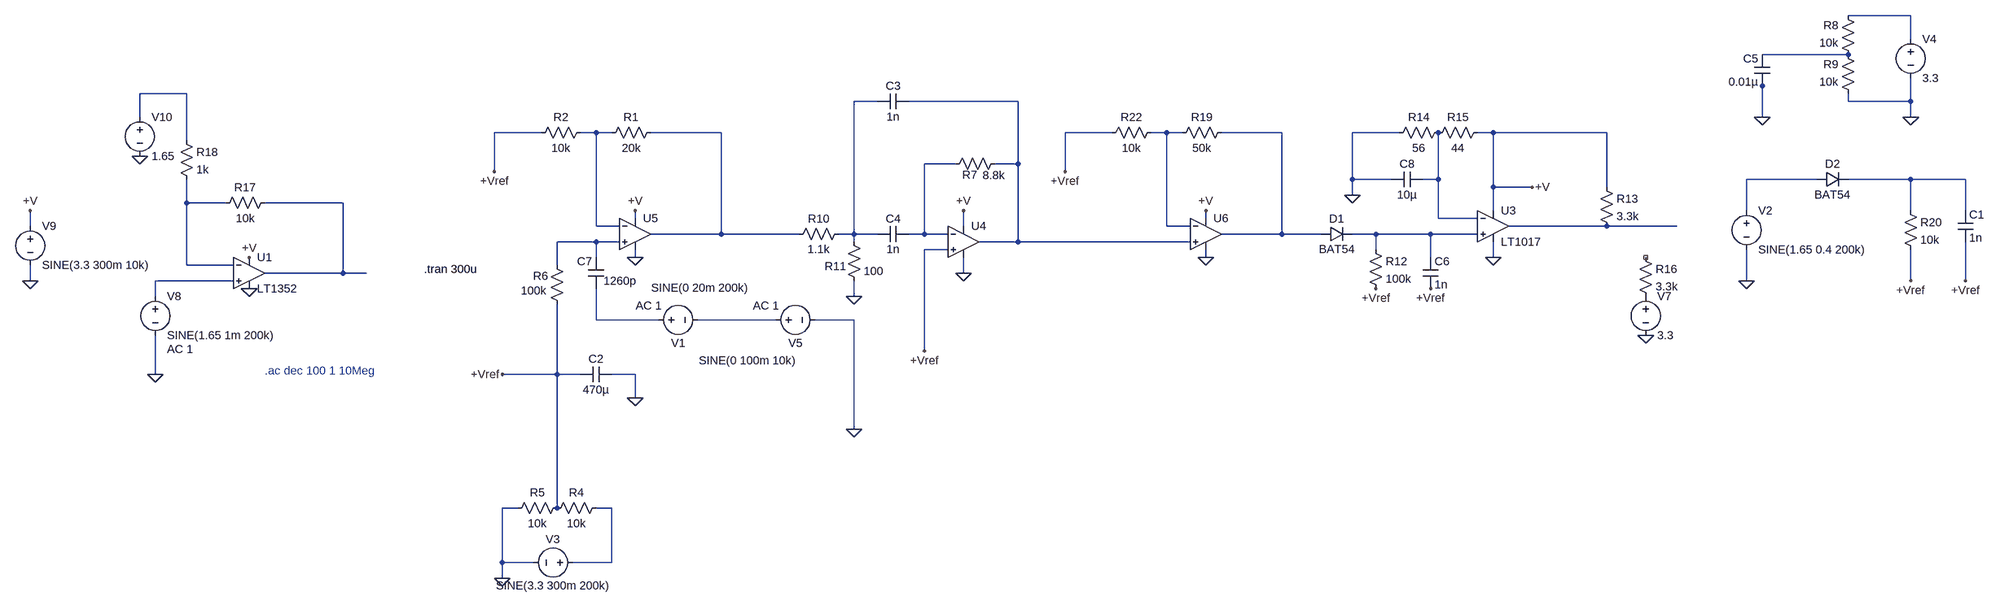
[diagram p0: schematic RX_module.asc]
RX_module.asc, the LTspice schematic file:
Version 4.1
SHEET 1 4340 1120
WIRE 3104 -96 2976 -96
WIRE 3104 -48 3104 -96
WIRE 2976 -16 2800 -16
WIRE 2800 48 2800 32
WIRE -528 64 -624 64
WIRE 896 80 848 80
WIRE 1184 80 960 80
WIRE 2976 80 2976 64
WIRE 3104 80 3104 32
WIRE 3104 80 2976 80
WIRE -624 112 -624 64
WIRE 2800 112 2800 48
WIRE 3104 112 3104 80
WIRE 208 144 112 144
WIRE 320 144 288 144
WIRE 352 144 320 144
WIRE 576 144 432 144
WIRE 1376 144 1280 144
WIRE 1488 144 1456 144
WIRE 1520 144 1488 144
WIRE 1744 144 1600 144
WIRE 1984 144 1888 144
WIRE 2176 144 2144 144
WIRE 2480 144 2176 144
WIRE -528 160 -528 64
WIRE 1056 208 992 208
WIRE 1184 208 1184 80
WIRE 1184 208 1136 208
WIRE 112 224 112 144
WIRE 1280 224 1280 144
WIRE 1888 240 1888 144
WIRE 1968 240 1888 240
WIRE 2064 240 2064 144
WIRE 2064 240 2032 240
WIRE 2912 240 2768 240
WIRE 3104 240 2976 240
WIRE 3216 240 3104 240
WIRE 2176 256 2176 144
WIRE 2256 256 2176 256
WIRE 2480 256 2480 144
WIRE 1888 272 1888 240
WIRE -528 288 -528 240
WIRE -448 288 -528 288
WIRE -208 288 -368 288
WIRE 2176 304 2176 256
WIRE 2768 304 2768 240
WIRE 3104 304 3104 240
WIRE 3216 304 3216 240
WIRE 400 320 400 304
WIRE 1568 320 1568 304
WIRE 2064 320 2064 240
WIRE 2144 320 2064 320
WIRE -848 336 -848 304
WIRE 320 336 320 144
WIRE 368 336 320 336
WIRE 1072 336 1072 304
WIRE 1488 336 1488 144
WIRE 1536 336 1488 336
WIRE 2480 336 2208 336
WIRE 2624 336 2480 336
WIRE 576 352 576 144
WIRE 576 352 432 352
WIRE 736 352 576 352
WIRE 848 352 848 80
WIRE 848 352 816 352
WIRE 896 352 848 352
WIRE 992 352 992 208
WIRE 992 352 960 352
WIRE 1040 352 992 352
WIRE 1744 352 1744 144
WIRE 1744 352 1600 352
WIRE 1824 352 1744 352
WIRE 1936 352 1888 352
WIRE 2048 352 1936 352
WIRE 2144 352 2048 352
WIRE 320 368 240 368
WIRE 368 368 320 368
WIRE 848 368 848 352
WIRE 1184 368 1184 208
WIRE 1184 368 1104 368
WIRE 1536 368 1184 368
WIRE 1040 384 992 384
WIRE 1936 384 1936 352
WIRE 320 400 320 368
WIRE 400 400 400 384
WIRE 1568 400 1568 384
WIRE 2048 400 2048 352
WIRE 2176 400 2176 368
WIRE -528 416 -528 288
WIRE -432 416 -528 416
WIRE 240 416 240 368
WIRE -208 432 -208 288
WIRE -208 432 -368 432
WIRE -160 432 -208 432
WIRE 1072 432 1072 400
WIRE -848 448 -848 416
WIRE -432 448 -592 448
WIRE 2768 448 2768 384
WIRE 3104 448 3104 384
WIRE 3216 448 3216 368
WIRE -592 480 -592 448
WIRE 848 480 848 448
WIRE 320 528 320 464
WIRE 448 528 320 528
WIRE 688 528 528 528
WIRE 848 528 768 528
WIRE 992 592 992 384
WIRE -592 640 -592 560
WIRE 240 640 240 496
WIRE 240 640 128 640
WIRE 288 640 240 640
WIRE 400 640 352 640
WIRE 400 688 400 640
WIRE 848 752 848 528
WIRE 160 944 128 944
WIRE 240 944 240 640
WIRE 352 944 320 944
WIRE 128 1056 128 944
WIRE 192 1056 128 1056
WIRE 352 1056 352 944
WIRE 352 1056 272 1056
WIRE 128 1088 128 1056
FLAG 400 400 0
FLAG 848 752 0
FLAG 128 1088 0
FLAG 3104 112 0
FLAG 2800 112 0
FLAG 848 480 0
FLAG 1072 432 0
FLAG 2176 400 0
FLAG 2560 560 0
FLAG -592 640 0
FLAG -400 400 +V
FLAG -400 464 0
FLAG -848 448 0
FLAG -848 304 +V
FLAG -624 192 0
FLAG 112 224 +Vref
FLAG 400 304 +V
FLAG 128 640 +Vref
FLAG 400 688 0
FLAG 1072 304 +V
FLAG 992 592 +Vref
FLAG 1568 400 0
FLAG 1280 224 +Vref
FLAG 1568 304 +V
FLAG 2768 448 0
FLAG 3104 448 +Vref
FLAG 3216 448 +Vref
FLAG 1888 272 0
FLAG 1936 464 +Vref
FLAG 2048 464 +Vref
FLAG 2256 256 +V
SYMBOL voltage 432 528 R270
WINDOW 0 -32 56 VBottom 2
WINDOW 3 50 100 VTop 2
WINDOW 123 13 -4 VTop 2
WINDOW 39 0 0 Left 0
SYMATTR InstName V1
SYMATTR Value SINE(0 20m 200k)
SYMATTR Value2 AC 1
SYMBOL res 448 128 R90
WINDOW 0 0 56 VBottom 2
WINDOW 3 32 56 VTop 2
SYMATTR InstName R1
SYMATTR Value 20k
SYMBOL res 304 128 R90
WINDOW 0 0 56 VBottom 2
WINDOW 3 32 56 VTop 2
SYMATTR InstName R2
SYMATTR Value 10k
SYMBOL OpAmps\\LT1352 -400 368 R0
SYMATTR InstName U1
SYMBOL res 336 928 R90
WINDOW 0 0 56 VBottom 2
WINDOW 3 32 56 VTop 2
SYMATTR InstName R4
SYMATTR Value 10k
SYMBOL res 256 928 R90
WINDOW 0 0 56 VBottom 2
WINDOW 3 32 56 VTop 2
SYMATTR InstName R5
SYMATTR Value 10k
SYMBOL voltage 288 1056 R90
WINDOW 0 -32 56 VBottom 2
WINDOW 3 32 56 VTop 2
WINDOW 123 0 0 Left 0
WINDOW 39 0 0 Left 0
SYMATTR InstName V3
SYMATTR Value SINE(3.3 300m 200k)
SYMBOL res 224 400 R0
WINDOW 0 -33 38 Left 2
WINDOW 3 -58 68 Left 2
SYMATTR InstName R6
SYMATTR Value 100k
SYMBOL res 1152 192 R90
WINDOW 0 54 67 VBottom 2
WINDOW 3 24 18 VTop 2
SYMATTR InstName R7
SYMATTR Value 8.8k
SYMBOL res 2992 0 R180
WINDOW 0 36 76 Left 2
WINDOW 3 36 40 Left 2
SYMATTR InstName R8
SYMATTR Value 10k
SYMBOL res 2992 80 R180
WINDOW 0 36 76 Left 2
WINDOW 3 36 40 Left 2
SYMATTR InstName R9
SYMATTR Value 10k
SYMBOL res 720 368 R270
WINDOW 0 32 56 VTop 2
WINDOW 3 0 56 VBottom 2
SYMATTR InstName R10
SYMATTR Value 1.1k
SYMBOL cap 960 64 R90
WINDOW 0 0 32 VBottom 2
WINDOW 3 32 32 VTop 2
SYMATTR InstName C3
SYMATTR Value 1n
SYMBOL cap 960 336 R90
WINDOW 0 0 32 VBottom 2
WINDOW 3 32 32 VTop 2
SYMATTR InstName C4
SYMATTR Value 1n
SYMBOL cap 2816 48 R180
WINDOW 0 24 56 Left 2
WINDOW 3 24 8 Left 2
SYMATTR InstName C5
SYMATTR Value 0.01µ
SYMBOL voltage 3104 -64 R0
WINDOW 123 0 0 Left 0
WINDOW 39 0 0 Left 0
SYMATTR InstName V4
SYMATTR Value 3.3
SYMBOL res 832 352 R0
WINDOW 0 -44 66 Left 2
SYMATTR InstName R11
SYMATTR Value 100
SYMBOL Comparators\\LT1017 2176 336 R0
SYMATTR InstName U3
SYMBOL res 2464 240 R0
SYMATTR InstName R13
SYMATTR Value 3.3k
SYMBOL res 2080 128 R90
WINDOW 0 0 56 VBottom 2
WINDOW 3 32 56 VTop 2
SYMATTR InstName R14
SYMATTR Value 56
SYMBOL res 2160 128 R90
WINDOW 0 0 56 VBottom 2
WINDOW 3 32 56 VTop 2
SYMATTR InstName R15
SYMATTR Value 44
SYMBOL res 2544 384 R0
SYMATTR InstName R16
SYMATTR Value 3.3k
SYMBOL voltage 2560 464 R0
WINDOW 123 0 0 Left 0
WINDOW 39 0 0 Left 0
SYMATTR InstName V7
SYMATTR Value 3.3
SYMBOL cap 336 464 R180
WINDOW 0 24 56 Left 2
WINDOW 3 -67 16 Left 2
SYMATTR InstName C7
SYMATTR Value 1260p
SYMBOL OpAmps\\UniversalOpAmp2 400 352 R0
SYMATTR InstName U5
SYMATTR Value2 Avol=1Meg GBW=3.1Meg Slew=10Meg
SYMBOL res -464 304 R270
WINDOW 0 32 56 VTop 2
WINDOW 3 0 56 VBottom 2
SYMATTR InstName R17
SYMATTR Value 10k
SYMBOL res -544 144 R0
SYMATTR InstName R18
SYMATTR Value 1k
SYMBOL voltage -592 464 R0
WINDOW 123 24 124 Left 2
WINDOW 39 0 0 Left 0
SYMATTR Value2 AC 1
SYMATTR InstName V8
SYMATTR Value SINE(1.65 1m 200k)
SYMBOL voltage -848 320 R0
WINDOW 123 0 0 Left 0
WINDOW 39 0 0 Left 0
SYMATTR InstName V9
SYMATTR Value SINE(3.3 300m 10k)
SYMBOL voltage -624 96 R0
WINDOW 123 0 0 Left 0
WINDOW 39 0 0 Left 0
SYMATTR InstName V10
SYMATTR Value 1.65
SYMBOL cap 352 624 R90
WINDOW 0 0 32 VBottom 2
WINDOW 3 32 32 VTop 2
SYMATTR InstName C2
SYMATTR Value 470µ
SYMBOL res 1616 128 R90
WINDOW 0 0 56 VBottom 2
WINDOW 3 32 56 VTop 2
SYMATTR InstName R19
SYMATTR Value 50k
SYMBOL res 1472 128 R90
WINDOW 0 0 56 VBottom 2
WINDOW 3 32 56 VTop 2
SYMATTR InstName R22
SYMATTR Value 10k
SYMBOL OpAmps\\UniversalOpAmp2 1568 352 R0
SYMATTR InstName U6
SYMATTR Value2 Avol=1Meg GBW=3.1Meg Slew=10Meg
SYMBOL OpAmps\\UniversalOpAmp2 1072 368 R0
SYMATTR InstName U4
SYMATTR Value2 Avol=1Meg GBW=200Meg Slew=10Meg
SYMBOL voltage 2768 288 R0
WINDOW 123 0 0 Left 0
WINDOW 39 0 0 Left 0
SYMATTR InstName V2
SYMATTR Value SINE(1.65 0.4 200k)
SYMBOL res 3088 288 R0
SYMATTR InstName R20
SYMATTR Value 10k
SYMBOL cap 3200 304 R0
SYMATTR InstName C1
SYMATTR Value 1n
SYMBOL diode 2912 256 R270
WINDOW 0 32 32 VTop 2
WINDOW 3 0 32 VBottom 2
SYMATTR InstName D2
SYMATTR Value BAT54
SYMBOL diode 1824 368 R270
WINDOW 0 32 32 VTop 2
WINDOW 3 0 32 VBottom 2
SYMATTR InstName D1
SYMATTR Value BAT54
SYMBOL res 1920 368 R0
SYMATTR InstName R12
SYMATTR Value 100k
SYMBOL cap 2032 400 R0
SYMATTR InstName C6
SYMATTR Value 1n
SYMBOL voltage 672 528 R270
WINDOW 0 -32 56 VBottom 2
WINDOW 3 -99 -42 VTop 2
WINDOW 123 13 -4 VTop 2
WINDOW 39 0 0 Left 0
SYMATTR InstName V5
SYMATTR Value SINE(0 100m 10k)
SYMATTR Value2 AC 1
SYMBOL cap 1968 256 R270
WINDOW 0 32 32 VTop 2
WINDOW 3 0 32 VBottom 2
SYMATTR InstName C8
SYMATTR Value 10µ
TEXT -32 424 Left 2 !.tran 300u
TEXT -368 632 Left 2 ;.ac dec 100 1 10Meg

The netlist it stands for:
* RX_module.asc
V1 N020 N021 SINE(0 20m 200k) AC 1
R1 N007 N006 20k
R2 N006 +Vref 10k
X§U1 N019 N014 +V 0 N015 LT1352  ; pins In+ In- V+ V- OUT
R4 N022 +Vref 10k
R5 +Vref 0 10k
V3 N022 0 SINE(3.3 300m 200k)
R6 N018 +Vref 100k
R7 N005 N010 8.8k
R8 N002 N001 10k
R9 0 N002 10k
R10 N007 N004 1.1k
C3 N005 N004 1n
C4 N010 N004 1n
C5 0 N002 0.01µ
V4 N001 0 3.3
R11 N004 0 100
X§U3 N017 N011 +V 0 N016 LT1017  ; pins In+ In- V+ V- OUT
R13 +V N016 3.3k
R14 N011 0 56
R15 +V N011 44
R16 NC_01 P001 3.3k
V7 P001 0 3.3
C7 N020 N018 1260p
X§U5 N018 N006 +V 0 N007 level2 Avol=1Meg GBW=3.1Meg Slew=10Meg Ilimit=25m Rail=0 Vos=0 En=0 Enk=0 In=0 Ink=0 Rin=500Meg  ; pins In+ In- V+ V- OUT
R17 N014 N015 10k
R18 N003 N014 1k
V8 N019 0 SINE(1.65 1m 200k) AC 1
V9 +V 0 SINE(3.3 300m 10k)
V10 N003 0 1.65
C2 0 +Vref 470µ
R19 N009 N008 50k
R22 N008 +Vref 10k
X§U6 N005 N008 +V 0 N009 level2 Avol=1Meg GBW=3.1Meg Slew=10Meg Ilimit=25m Rail=0 Vos=0 En=0 Enk=0 In=0 Ink=0 Rin=500Meg  ; pins In+ In- V+ V- OUT
X§U4 +Vref N010 +V 0 N005 level2 Avol=1Meg GBW=200Meg Slew=10Meg Ilimit=25m Rail=0 Vos=0 En=0 Enk=0 In=0 Ink=0 Rin=500Meg  ; pins In+ In- V+ V- OUT
V2 N012 0 SINE(1.65 0.4 200k)
R20 N013 +Vref 10k
C1 N013 +Vref 1n
D2 N012 N013 BAT54
D1 N009 N017 BAT54
R12 N017 +Vref 100k
C6 N017 +Vref 1n
V5 N021 0 SINE(0 100m 10k) AC 1
C8 0 N011 10µ
.model D D
.lib standard.dio
.tran 300u
* .ac dec 100 1 10Meg
.lib LTC.lib
.lib UniversalOpAmp2.lib
.backanno
.end